# Altium schematic sheet Power.SchDoc
size A; SheetNumber: 2; SheetTotal: 6
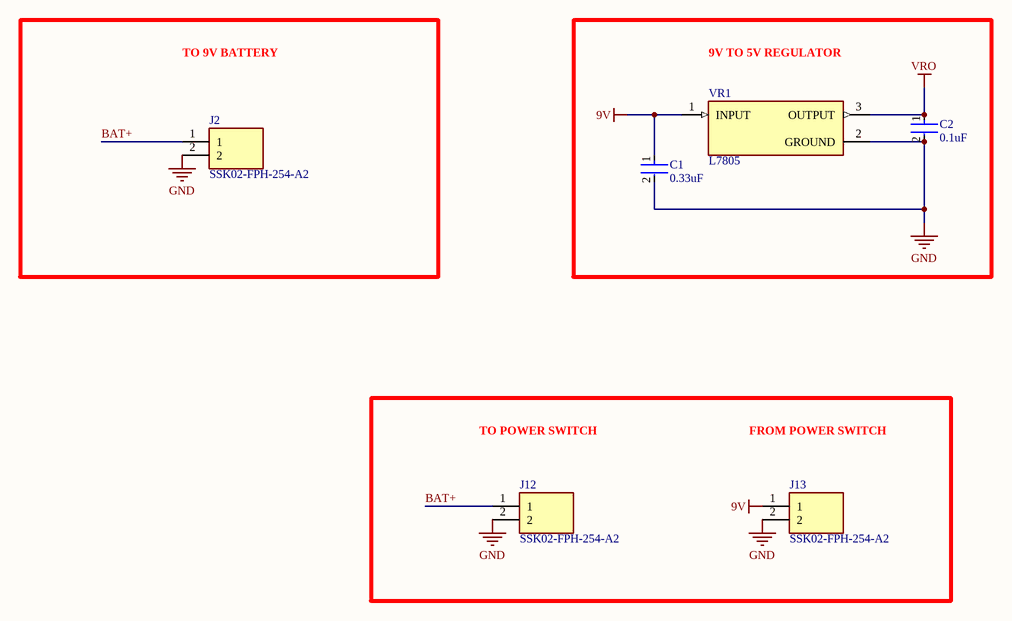
[diagram p0: Power.SchDoc]

## Parts
C1  0.33uF  [FP-RHE1DB-MFG]
C2  0.1uF  [FP-RHE1DB-MFG]
J2  SSK02-FPH-254-A2  [SAMESKY_SSK02-FPH-254-A2]
J12  SSK02-FPH-254-A2  [SAMESKY_SSK02-FPH-254-A2]
J13  SSK02-FPH-254-A2  [SAMESKY_SSK02-FPH-254-A2]
VR1  L7805  [TO255P1020X450X2000-3]

## Blocks framed on the sheet
TO 9V BATTERY: J2
9V TO 5V REGULATOR: C1 C2 VR1

## Nets
9V: C1.1 J13.1 VR1.1(INPUT)
GND: C1.2 C2.2 J2.2 J12.2 J13.2 VR1.2(GROUND)
VRO: C2.1 VR1.3(OUTPUT)
BAT+: J2.1 J12.1

## Notes on the sheet
- TO POWER SWITCH
- FROM POWER SWITCH

## Library data of the parts
C1 C2 = CMP-06035-012170-1: Ceramic Capacitor Automotive 330nF ±10% 50V X8L Radial; Tolerance: 10%; Lead Pitch: 2.5mm; Capacitance: 330nF; Max Operating Temperature: 150°C; Dielectric: X8L; Voltage Rating: 50V; Voltage Rating (DC): 50V; Min Operating Temperature: -55°C; REACH SVHC: No SVHC
J2 J12 J13 = SSK02-FPH-254-A2: 2 Position Header Connector 0.100 (2.54mm) Through Hole Gold; MF: Same Sky (Formerly CUI Devices); SnapEDA_Link: https://www.snapeda.com/parts/SSK02-FPH-254-A2/Same+Sky/view-part/?ref=snap; Package: None; Value: *; MP: SSK02-FPH-254-A2; Check_prices: https://www.snapeda.com/parts/SSK02-FPH-254-A2/Same+Sky/view-part/?ref=eda
VR1 = L7805: Standard Regulator Pos 5V 1.5A 3-Pin(3+Tab) TO-220FP Tube; MF: STMicroelectronics; MP: L7805; Value: *; SnapEDA_Link: https://www.snapeda.com/parts/L7805/STMicroelectronics/view-part/?ref=snap; Price: None; Package: None; Check_prices: https://www.snapeda.com/parts/L7805/STMicroelectronics/view-part/?ref=eda; Availability: Not in stock